# EasyEDA Pro project WiFiController.epro

# Schematic PIR sensor logical invertor
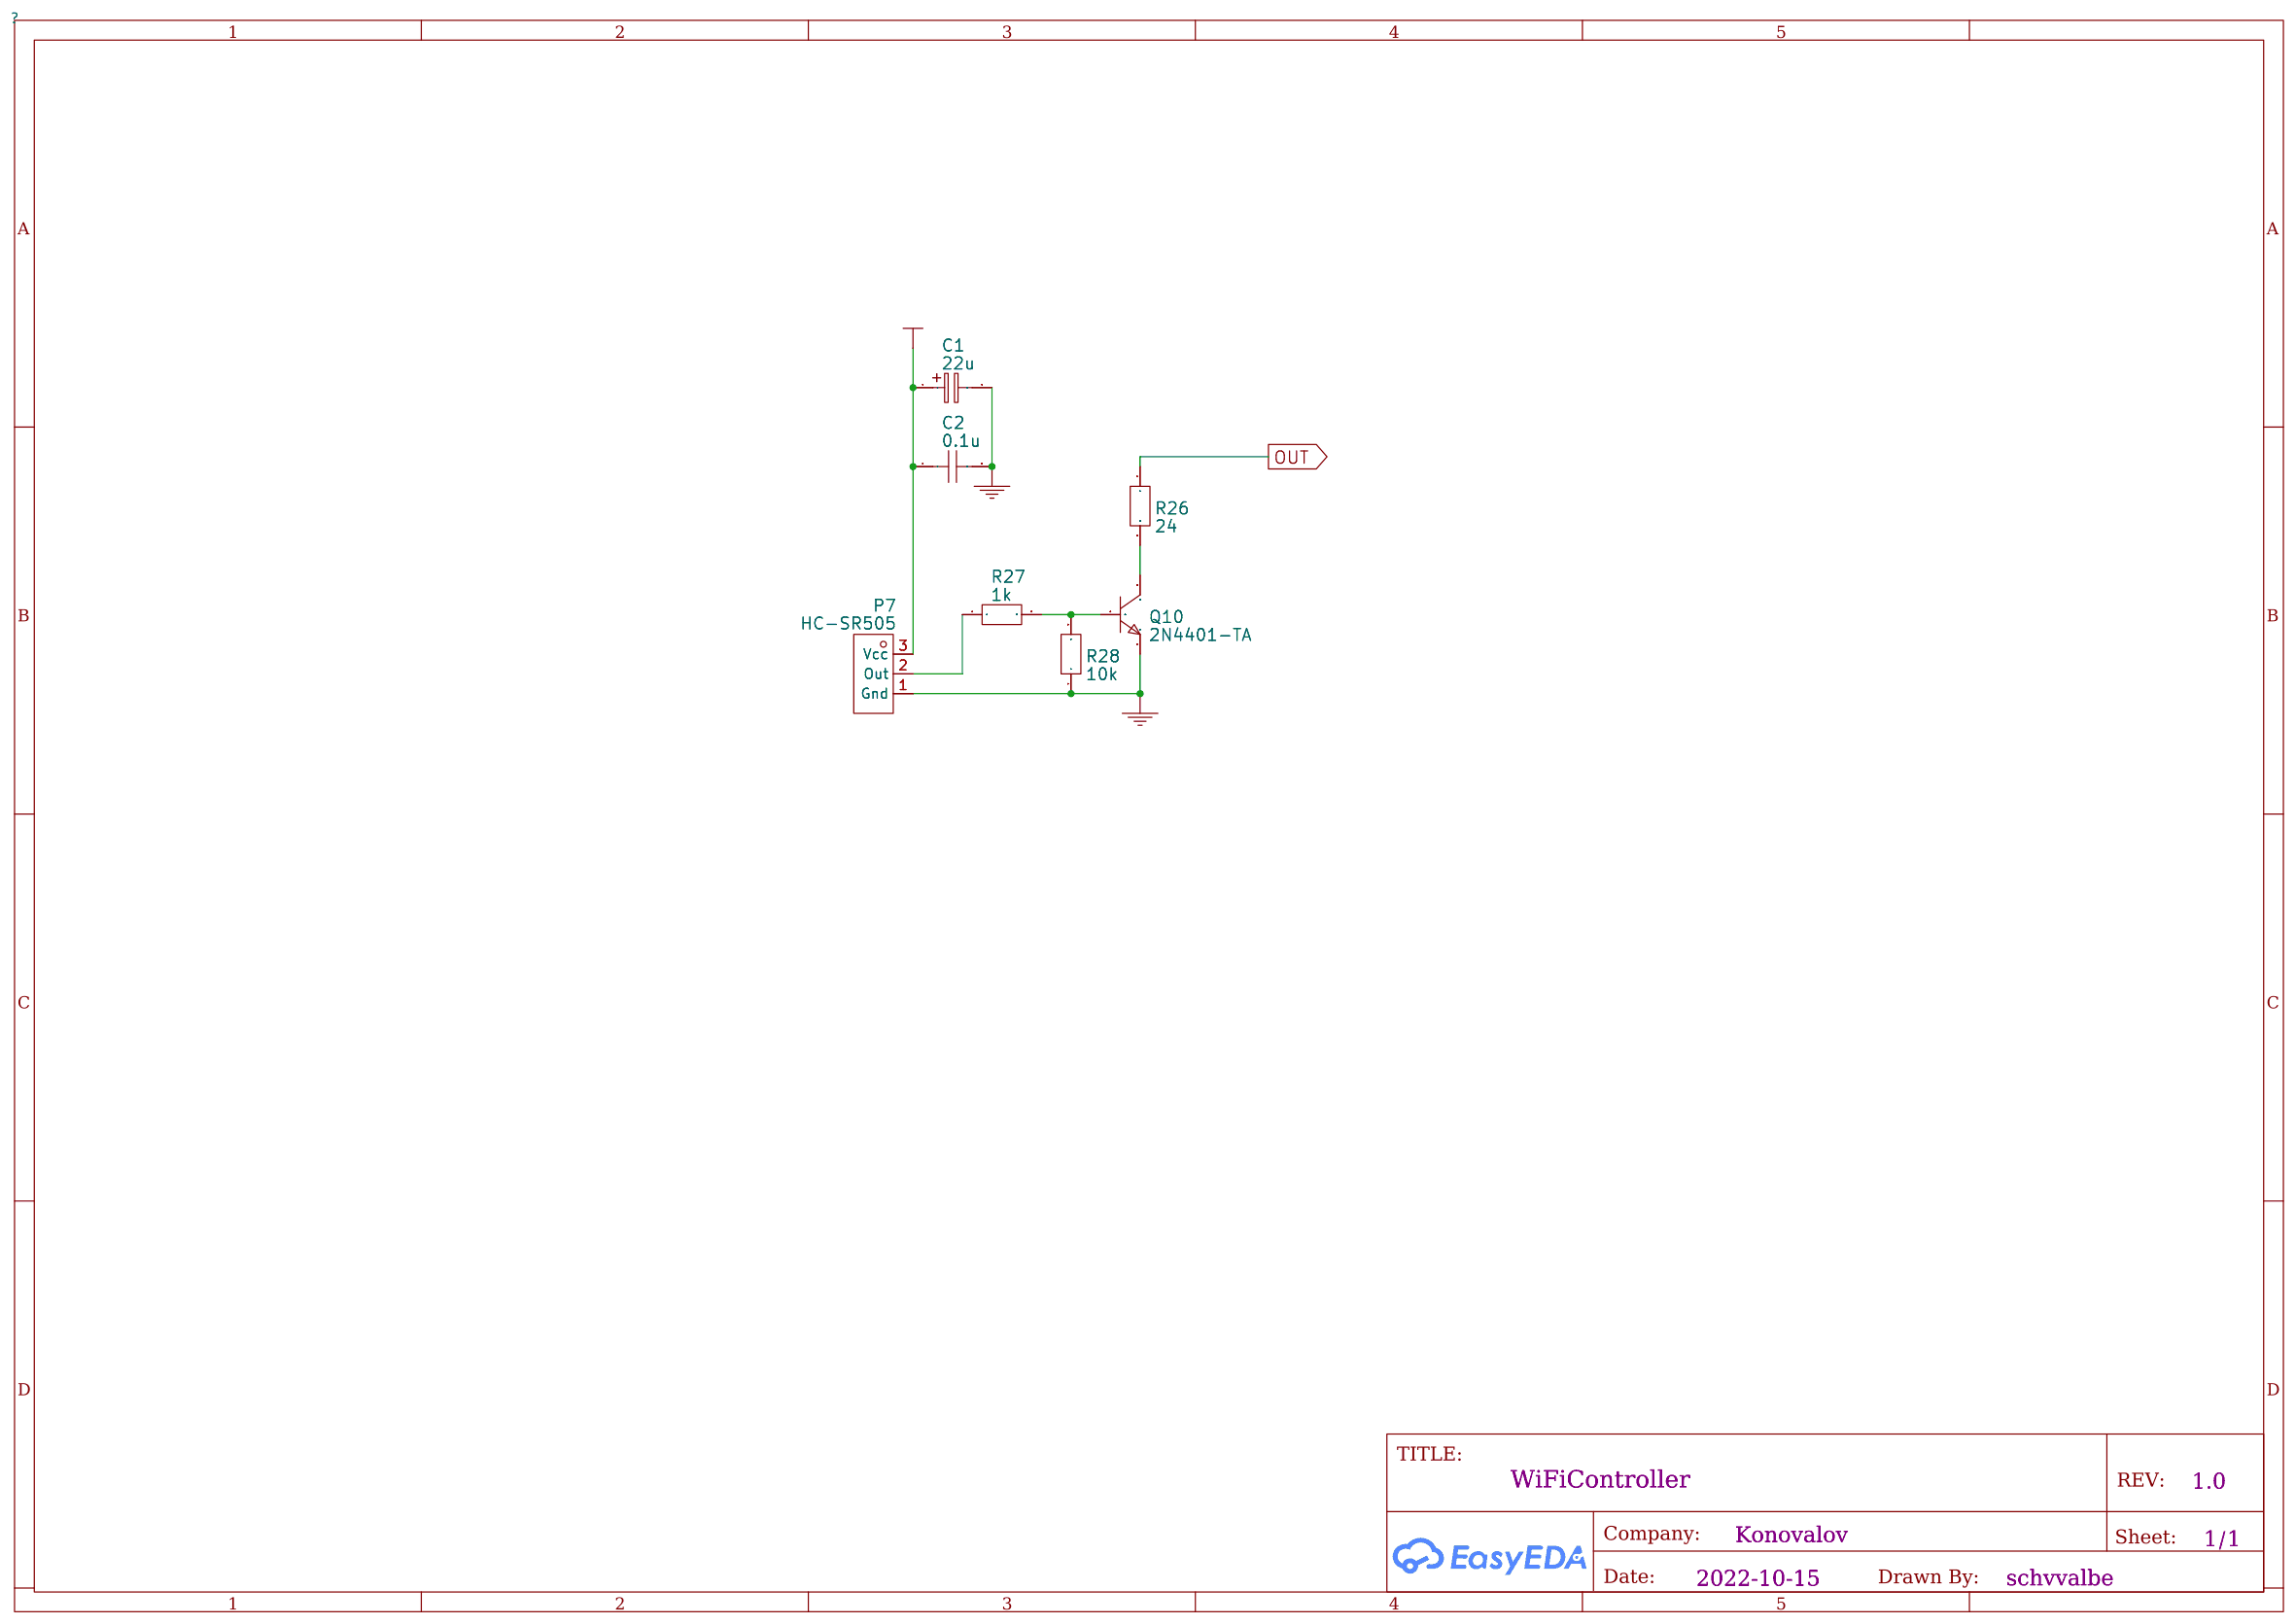
[diagram p0: schematic sheet]

## Parts
C1  22u
C2  0.1u
P7  HC-SR505
Q10  2N4401-TA
R26  24
R27  1k
R28  10k

## Library data of the parts
C1 = 22u
C2 = 0.1u
P7 = DG308-2.54-03P-14-00A(H): Supplier: LCSC; Supplier Part: C691850; Manufacturer: DEGSON; JLCPCB Part Class: Extended Part
Q10 = 2N4401-TA: Supplier: LCSC; Supplier Part: C2910416; Manufacturer: CJ（江苏长电/长晶）
R26 = 24
R27 = 1k
R28 = 10k

## Nets
+12V: C1.1 C2.1 P7.3(Vcc)
GND: C1.2 C2.2 P7.1(Gnd) Q10.1(E) R28.1
OUT: R26.1
Net-(P7-2): P7.2(Out) R27.1
Net-(Q10-2): Q10.2(B) R27.2 R28.2
Net-(Q10-3): Q10.3(C) R26.2

# Schematic ESP8266Board
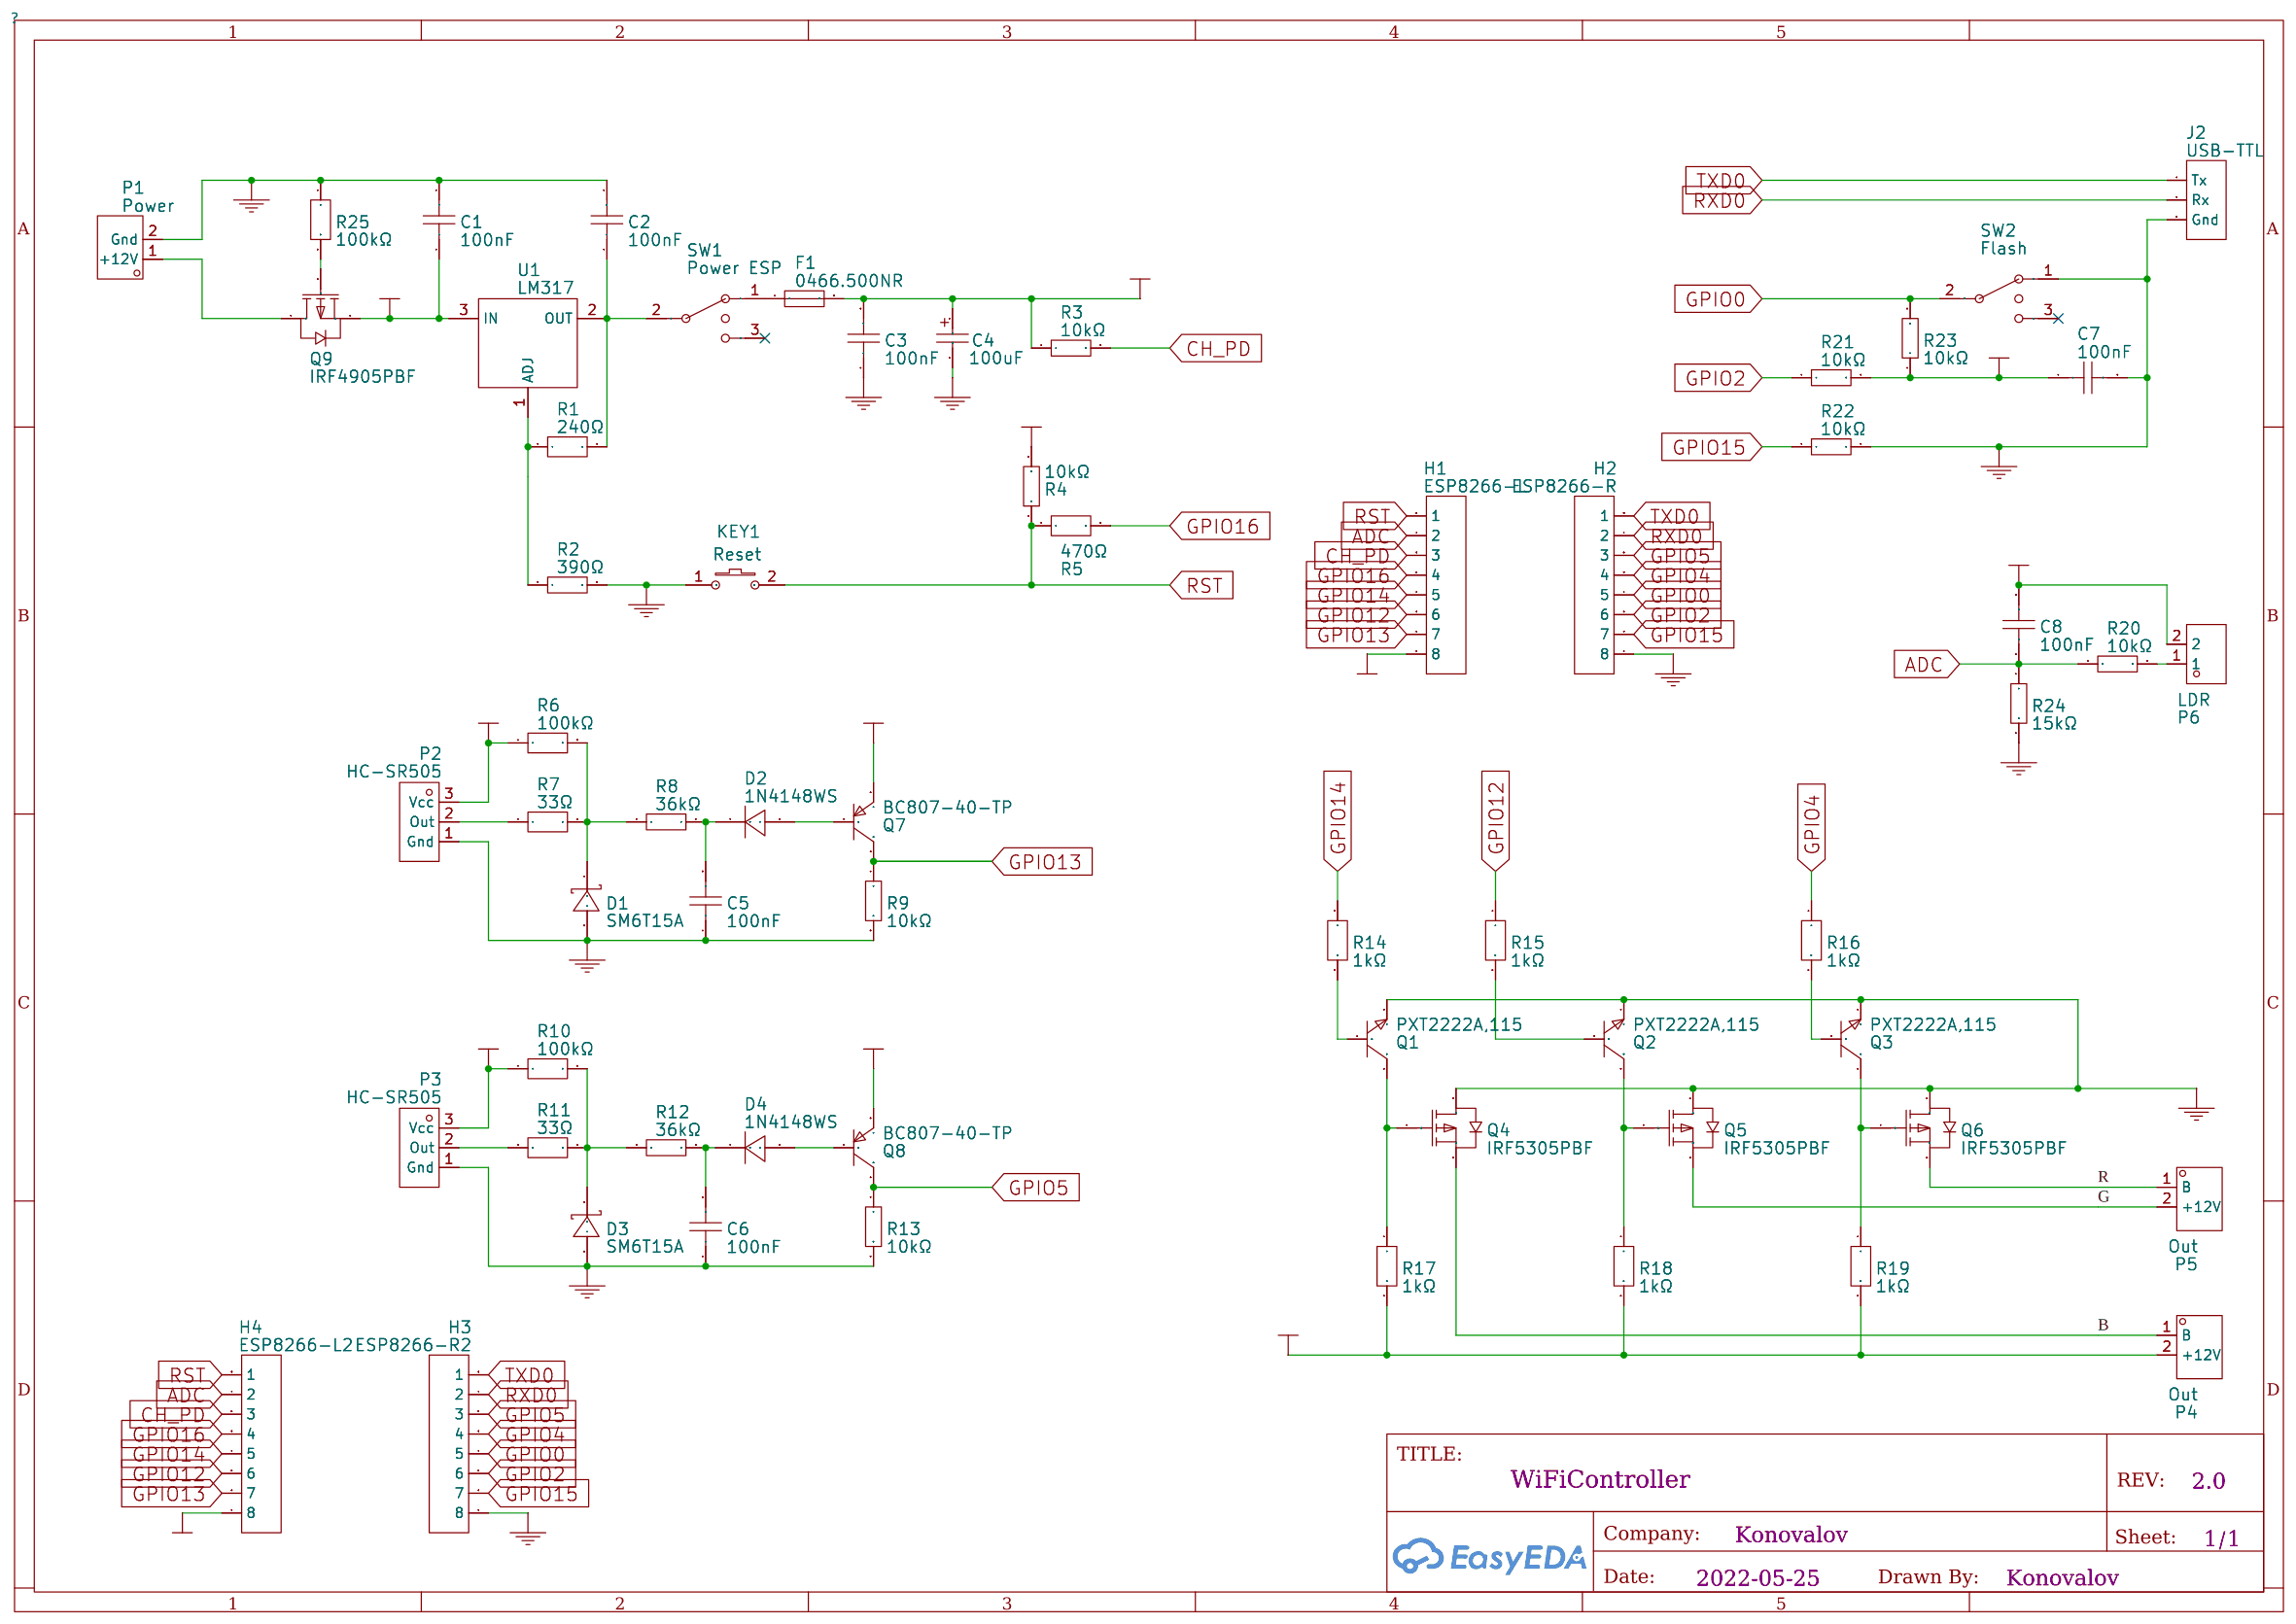
[diagram p1: schematic sheet]

## Parts
C1  100nF  [C1206]
C2  100nF  [C1206]
C3  100nF  [C1206]
C4  100uF  [CAP-SMD_L7.3-W4.3-R-RD]
C5  100nF  [C1206]
C6  100nF  [C1206]
C7  100nF  [C1206]
C8  100nF  [C1206]
D1  SM6T15A  [SMB_L4.6-W3.6-LS5.3-RD]
D2  1N4148WS  [SOD-323F_L2.0-W1.6-LS2.5-RD]
D3  SM6T15A  [SMB_L4.6-W3.6-LS5.3-RD]
D4  1N4148WS  [SOD-323F_L2.0-W1.6-LS2.5-RD]
F1  0466.500NR  [F1206]
H1  ESP8266-L  [HDR-F-2.54_1X8]
H2  ESP8266-R  [HDR-F-2.54_1X8]
H3  ESP8266-R2  [HDR-F-2.54_1X8]
H4  ESP8266-L2  [HDR-F-2.54_1X8]
J2  USB-TTL  [USB-TTL]
KEY1  Reset  [RESET]
P1  Power  [POWER]
P2  HC-SR505  [HC-SR505 2]
P3  HC-SR505  [HC-SR505 2]
P4  Out  [POWER]
P5  Out  [POWER]
P6  LDR  [LDR]
Q1  PXT2222A,115  [SOT-89-3_L4.5-W2.5-P1.50-LS4.1-TR]
Q2  PXT2222A,115  [SOT-89-3_L4.5-W2.5-P1.50-LS4.1-TR]
Q3  PXT2222A,115  [SOT-89-3_L4.5-W2.5-P1.50-LS4.1-TR]
Q4  IRF5305PBF  [TO-220-3_L10.0-W4.5-P2.54-T]
Q5  IRF5305PBF  [TO-220-3_L10.0-W4.5-P2.54-T]
Q6  IRF5305PBF  [TO-220-3_L10.0-W4.5-P2.54-T]
Q7  BC807-40-TP  [SOT-23-3_L2.9-W1.3-P1.90-LS2.4-BR]
Q8  BC807-40-TP  [SOT-23-3_L2.9-W1.3-P1.90-LS2.4-BR]
Q9  IRF4905PBF  [TO-220-3_L10.0-W4.5-P2.54-L]
R1  240Ω  [R0603]
R2  390Ω  [R1206]
R3  10kΩ  [R1206]
R4  10kΩ  [R1206]
R5  470Ω  [R0603]
R6  100kΩ  [R1206]
R7  33Ω  [R1206]
R8  36kΩ  [R1206]
R9  10kΩ  [R1206]
R10  100kΩ  [R1206]
R11  33Ω  [R1206]
R12  36kΩ  [R1206]
R13  10kΩ  [R1206]
R14  1kΩ  [R1206]
R15  1kΩ  [R1206]
R16  1kΩ  [R1206]
R17  1kΩ  [R1206]
R18  1kΩ  [R1206]
R19  1kΩ  [R1206]
R20  10kΩ  [R1206]
R21  10kΩ  [R1206]
R22  10kΩ  [R1206]
R23  10kΩ  [R1206]
R24  15kΩ  [R0805]
R25  100kΩ  [R1206]
SW1  Power ESP  [KLS7-SS03-12D02-EG-3.0]
SW2  Flash  [KLS7-SS03-12D02-EG-3.0]
U1  LM317  [LM317]

## Library data of the parts
C1-C3 C5-C8 = 100nF: link: https://item.szlcsc.com/89171.html; 3DModel: C1206_L3.2-W1.6-H1.3; Supplier: LCSC; Supplier Part: C24497; Manufacturer: CCTC; Manufacturer Part: TCC1206X7R104M500DT; JLCPCB Part Class: Basic
C4 = 100uF: Supplier: LCSC; Manufacturer: AVX; Manufacturer Part: TAJE107M025RNJ; Supplier Part: C7230; JLCPCB Part Class: Extended Part; link: https://item.szlcsc.com/91116.html; 3DModel: CASE-E_L7.3-W4.3-H4.1
D1 D3 = SM6T15A: Supplier: LCSC; Manufacturer: STMicroelectronics; Supplier Part: C118275; JLCPCB Part Class: Extended Part; link: https://item.szlcsc.com/288502.html
D2 D4 = 1N4148WS: Supplier: LCSC; Supplier Part: C2128; Manufacturer: ON Semicon; JLCPCB Part Class: Extended Part; link: https://item.szlcsc.com/111628.html; 3DModel: SOD-323F_L1.6-W1.3-H1.1-LS2.7
F1 = 0466.500NR: Supplier: LCSC; Supplier Part: C206988; Manufacturer: Littelfuse; JLCPCB Part Class: Extended Part; 3DModel: F1206_L3.2-W1.7-H0.6; link: https://atta.szlcsc.com/upload/public/pdf/source/20200518/C553934_4CFF0660EAE88BF7A646763F248900C5.pdf
H1 = ESP8266-L: 3DModel: HDR-F-2.54_1x8; Supplier Part: C225505; Supplier: LCSC
H2 = ESP8266-R: 3DModel: HDR-F-2.54_1x8; Supplier Part: C225505; Supplier: LCSC
H3 = ESP8266-R2: 3DModel: HDR-F-2.54_1x8; Supplier Part: C225505; Supplier: LCSC
H4 = ESP8266-L2: 3DModel: HDR-F-2.54_1x8; Supplier Part: C225505; Supplier: LCSC
J2 = USB-TTL: Supplier Part: C180248; Supplier: LCSC; 3DModel: HDR-M-2.54_1x3
KEY1 = Reset: Supplier Part: C118141; Supplier: LCSC; Manufacturer Part: K2-1107ST-A4SW-06; 制造商: 韩国韩荣; 3DModel: KEY-SMD_2P-L6.2-W3.6-LS8.0; link: https://so.szlcsc.com/global.html?c=&k=C498306
P1 = Power: Supplier Part: C8445; Supplier: LCSC; 3DModel: KF301-2POLES_sp
P2 P3 = HC-SR505: Supplier: LCSC; Supplier Part: C691850; Manufacturer: DEGSON; Manufacturer Part: DG308-2.54-03P-14-00A(H); JLCPCB Part Class: Extended Part; link: https://item.szlcsc.com/723608.html?ref=editor&logined=true; 3DModel: CONN-TH_DG308-2.54-03P-14-00A-H
P4 P5 = Out: Supplier Part: C8445; Supplier: LCSC; 3DModel: KF301-2POLES_sp
P6 = LDR: link: https://item.szlcsc.com/734134.html; 3DModel: CONN-TH_DG308-2.54-02P-14-00A; Supplier: LCSC; Supplier Part: C699496; Manufacturer: DEGSON; Manufacturer Part: DG308-2.54-02P-14-00A(H); JLCPCB Part Class: Extended Part
Q1-Q3 = PXT2222A,115: Supplier: LCSC; Supplier Part: C426879; Manufacturer: Nexperia; JLCPCB Part Class: Extended Part; link: https://item.szlcsc.com/141709.html; 3DModel: SOT-89-3_L4.3-W2.5-H1.6-LS4.1-P1.50
Q4-Q6 = IRF5305PBF: Supplier: LCSC; Manufacturer: IR; Supplier Part: C2623; JLCPCB Part Class: Extended Part; link: https://item.szlcsc.com/88574.html; 3DModel: TO-220-3_L10.0-W4.5-P2.54
Q7 Q8 = BC807-40-TP: link: https://www.diodes.com/assets/Package-Files/SOT23.pdf; 3DModel: SOT-23-3P_L2.9-W1.3-H1.0-LS2.4-P0.95; Supplier: LCSC; Supplier Part: C668872; Manufacturer: MCC(Micro Commercial Components); JLCPCB Part Class: Extended Part
Q9 = IRF4905PBF: link: https://item.szlcsc.com/233115.html; Supplier: LCSC; Supplier Part: C558142; Manufacturer: VBsemi Elec; JLCPCB Part Class: Extended Part
R1 = 240Ω: Supplier: LCSC; Supplier Part: C23350; Manufacturer: PANASONIC; Manufacturer Part: ERA3AEB241V; JLCPCB Part Class: Extended Part; 3DModel: R0603_L1.6-W0.8-H0.8; link: https://www.mouser.in/datasheet/2/447/PYu_RT_1_to_0_01_RoHS_L_11-1669912.pdf
R2 = 390Ω: Supplier: LCSC; Manufacturer: FH; Manufacturer Part: RS-06K3900FT; Supplier Part: C140022; Resistance: 390; JLCPCB Part Class: Extended Part; link: https://item.szlcsc.com/311874.html; 3DModel: R1206_L3.2-W1.6-H0.6
R3 R9 R13 R20-R23 = 10kΩ: link: https://item.szlcsc.com/311874.html; 3DModel: R1206_L3.2-W1.6-H0.6; Supplier: LCSC; Supplier Part: C17902; Manufacturer: Viking Tech; Manufacturer Part: AR06BTCV1002; Resistance: 10K; JLCPCB Part Class: Extended Part
R4 = 10kΩ: Supplier: LCSC; Supplier Part: C17902; Manufacturer: Viking Tech; Manufacturer Part: AR06BTCV1002; Resistance: 10K; JLCPCB Part Class: Extended Part; link: https://item.szlcsc.com/311874.html; 3DModel: R1206_L3.2-W1.6-H0.6
R5 = 470Ω: Supplier: LCSC; Supplier Part: C23179; Manufacturer: Viking Tech; Manufacturer Part: AR03BTC4700; JLCPCB Part Class: Extended Part; 3DModel: R0603_L1.6-W0.8-H0.8; link: https://www.mouser.in/datasheet/2/447/PYu_RT_1_to_0_01_RoHS_L_11-1669912.pdf
R6 R10 R25 = 100kΩ: link: https://item.szlcsc.com/311874.html; 3DModel: R1206_L3.2-W1.6-H0.6; Supplier: LCSC; Supplier Part: C17900; Manufacturer: Viking Tech; Manufacturer Part: ARG06BTC1003; Resistance: 100K; JLCPCB Part Class: Extended Part
R7 R11 = 33Ω: Supplier: LCSC; Supplier Part: C966057; Manufacturer: UNI-ROYAL(Uniroyal Elec); Manufacturer Part: AS06W2J0330T5E; JLCPCB Part Class: Extended Part; link: https://item.szlcsc.com/311874.html; 3DModel: R1206_L3.2-W1.6-H0.6
R8 R12 = 36kΩ: Supplier: LCSC; Manufacturer: YAGEO; Manufacturer Part: RT1206BRD0736KL; Supplier Part: C136884; JLCPCB Part Class: Extended Part; link: https://item.szlcsc.com/311874.html; 3DModel: R1206_L3.2-W1.6-H0.6
R14-R19 = 1kΩ: Supplier: LCSC; Supplier Part: C4410; Manufacturer: YAGEO; Manufacturer Part: RT1206DRD071KL; JLCPCB Part Class: Extended Part; link: https://item.szlcsc.com/311874.html; 3DModel: R1206_L3.2-W1.6-H0.6
R24 = 15kΩ: link: https://item.szlcsc.com/142685.html; 3DModel: R0805_L2.0-W1.3-H0.6; Supplier: LCSC; Manufacturer: UniOhm; Manufacturer Part: 0805W8F1502T5E; Supplier Part: C17475; Resistance: 15K; JLCPCB Part Class: Basic Part
SW1 = Power ESP: Supplier: LCSC; Supplier Part: C273378; Manufacturer: E-Switch; Manufacturer Part: 500SSP1S1M2REA; 3DModel: SW-TH_SS-12D01-GX
SW2 = Flash: Supplier: LCSC; Supplier Part: C273378; Manufacturer: E-Switch; Manufacturer Part: 500SSP1S1M2REA; 3DModel: SW-TH_SS-12D01-GX
U1 = LM317: Supplier: LCSC; Manufacturer: CJ; Supplier Part: C22147; JLCPCB Part Class: Extended Part; link: https://item.szlcsc.com/233115.html; 3DModel: TO-220-3_L10.0-W4.5-P2.54-L

## Nets
+3.3V: C3.2 C4.1 C7.1 C8.2 F1.2 H1.1(8) H4.1(8) P6.2 Q7.2(E) Q8.2(E) R3.1 R4.2 R21.2 R23.1
+12V: C1.1 P2.3(Vcc) P3.3(Vcc) P4.2(+12V) Q9.3(S) R6.1 R10.1 R17.2 R18.2 R19.2 U1.3(IN)
GND: C1.2 C2.2 C3.1 C4.2 C5.1 C6.1 C7.2 D1.2(A) D3.2(A) H2.1(8) H3.1(8) J2.3(Gnd) KEY1.1 P1.2(Gnd) P2.1(Gnd) P3.1(Gnd) Q1.1(E) Q2.1(E) Q3.1(E) Q4.2(D) Q5.2(D) Q6.2(D) R2.2 R9.2 R13.2 R22.2 R24.2 R25.1 SW2.1
ADC: C8.1 H1.7(2) H4.7(2) R20.1 R24.1
B: P4.1(B) Q4.3(S)
CH_PD: H1.6(3) H4.6(3) R3.2
G: P5.2(G) Q5.3(S)
GPIO0: H2.4(5) H3.4(5) R23.2 SW2.2
GPIO2: H2.3(6) H3.3(6) R21.1
GPIO4: H2.5(4) H3.5(4) R16.1
GPIO5: H2.6(3) H3.6(3) Q8.3(C) R13.1
GPIO12: H1.3(6) H4.3(6) R15.1
GPIO13: H1.2(7) H4.2(7) Q7.3(C) R9.1
GPIO14: H1.4(5) H4.4(5) R14.1
GPIO15: H2.2(7) H3.2(7) R22.1
GPIO16: H1.5(4) H4.5(4) R5.2
R: P5.1(R) Q6.3(S)
RST: H1.8(1) H4.8(1) KEY1.2 R4.1 R5.1
RXD0: H2.7(2) H3.7(2) J2.2(Rx)
TXD0: H2.8(1) H3.8(1) J2.1(Tx)
C5_2: C5.2 D2.1(C) R8.2
D1_1: D1.1(K) R6.2 R7.2 R8.1
D2_2: D2.2(A) Q7.1(B)
Net-(Q1-2): Q1.2(C) Q4.1(G) R17.1
Net-(Q2-2): Q2.2(C) Q5.1(G) R18.1
Net-(Q3-2): Q3.2(C) Q6.1(G) R19.1
P1_1: P1.1(+12V) Q9.2(D)
P2_2: P2.2(Out) R7.1
P6_1: P6.1 R20.2
Q8_1: D4.2(A) Q8.1(B)
R10_2: D3.1(K) R10.2 R11.2 R12.1
R11_1: P3.2(Out) R11.1
R12_2: C6.2 D4.1(C) R12.2
R14_2: Q1.3(B) R14.2
R15_2: Q2.3(B) R15.2
R16_2: Q3.3(B) R16.2
R25_2: Q9.1(G) R25.2
SW1_1: F1.1 SW1.1
SW1_2: C2.1 R1.2 SW1.2 U1.2(OUT)
U1_1: R1.1 R2.1 U1.1(ADJ)

Not connected (* = marked no-connect by the designer): SW1 3*; SW2 3*

# Board 1-PCB_ESP8266Board
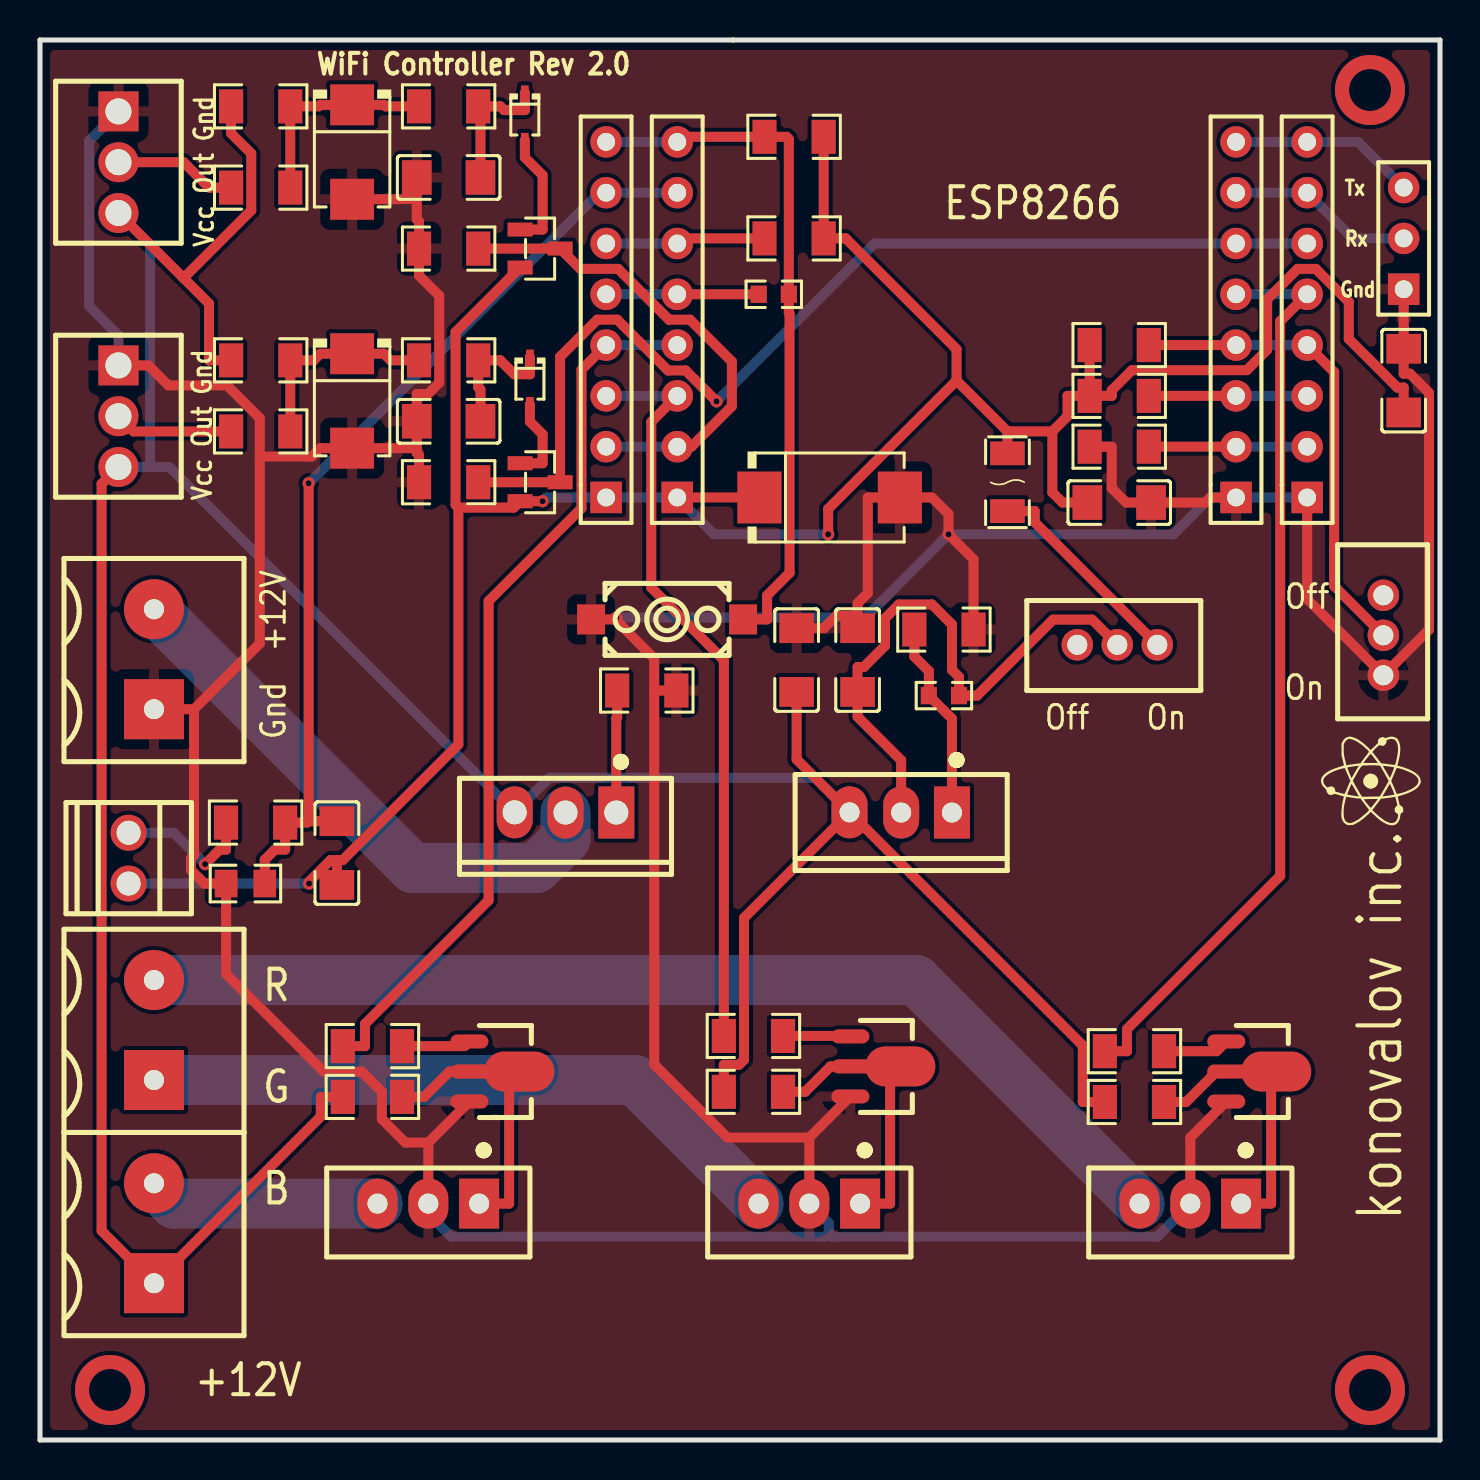
[diagram p2: board, top side]
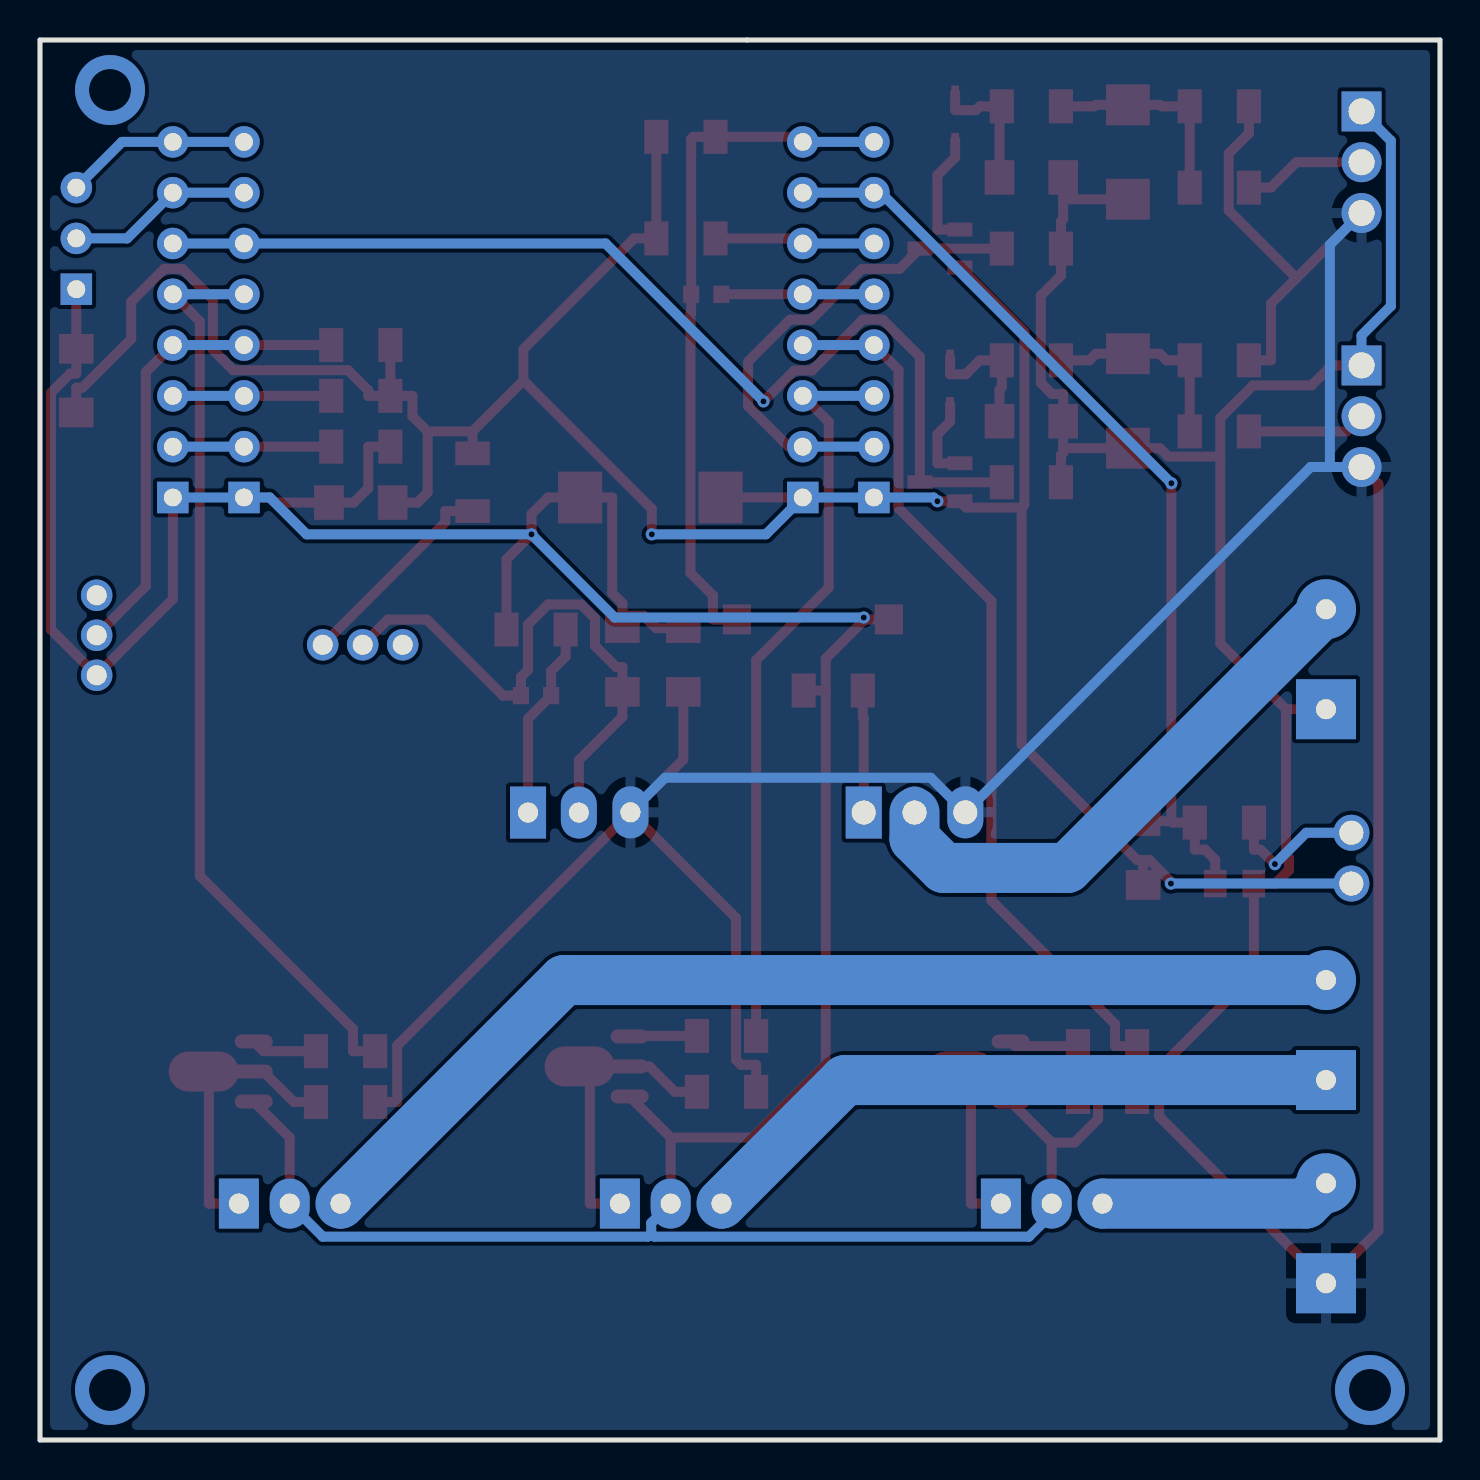
[diagram p3: board, bottom side, seen from below]

Outline 70 x 70 mm; copper layers: Top Layer, Bottom Layer. Coordinates in mm from the lower left corner of the outline.
Outline path: 0,70 70,70 70,0 0,0 0,70
Stack: Top Layer 0.035mm / Dielectric1 1.51mm FR4 er 4.5 / Bottom Layer 0.035mm

## Design rules (mm)
spacing Default (default): track to track 0.152, other pairs 0 to 0.152
spacing ESP_power: track to track 0.152, other pairs 0 to 0.152
spacing Power: track to track 0.152, other pairs 0 to 0.152
track width Default (default): min 0.5, default 0.5, max 25.4
track width ESP_power: min 0.5, default 0.5, max 25.4
track width Power: min 2.5, default 2.5, max 25.4
differential pair differentialPair (default): width min 0.127, default 0.254, max 2.54; gap min 0.152, default 0.152
via Default (default): diameter min 0.61, default 0.61, max 100.025; hole min 0.305, default 0.305, max 59.995
via ESP_power: diameter min 0.61, default 0.61, max 100.025; hole min 0.305, default 0.305, max 59.995
via Power: diameter min 0.61, default 0.61, max 100.025; hole min 0.305, default 0.305, max 59.995
net G uses Power
net B uses Power
net R uses Power
net P1_1 uses Power
net GND uses gge2551
pour e387 uses gge2551

## Placement (name value [footprint] x y rotation side)
C1  100nF  [C1206]  37.83 39 90 top
C2  100nF  [C1206]  40.88 39 90 top
C3  100nF  [C1206]  53.96 46.87 180 top
C4  100uF  [CAP-SMD_L7.3-W4.3-R-RD]  39.48 47.13 180 top
C5  100nF  [C1206]  20.43 63.13 0 top
C6  100nF  [C1206]  20.43 50.94 0 top
C7  100nF  [C1206]  68.18 52.97 90 top
C8  100nF  [C1206]  14.84 29.35 270 top
D1  SM6T15A  [SMB_L4.6-W3.6-LS5.3-RD]  15.61 64.4 270 top
D2  1N4148WS  [SOD-323F_L2.0-W1.6-LS2.5-RD]  24.24 66.18 270 top
D3  SM6T15A  [SMB_L4.6-W3.6-LS5.3-RD]  15.61 51.95 270 top
D4  1N4148WS  [SOD-323F_L2.0-W1.6-LS2.5-RD]  24.5 52.97 270 top
F1  0466.500NR  [F1206]  48.37 47.89 90 top
H1  ESP8266-L  [HDR-F-2.54_1X8]  31.86 54.75 90 top
H2  ESP8266-R  [HDR-F-2.54_1X8]  59.8 54.75 90 top
H3  ESP8266-R2  [HDR-F-2.54_1X8]  63.36 54.75 90 top
H4  ESP8266-L2  [HDR-F-2.54_1X8]  28.31 54.75 90 top
J2  -  [USB-TTL]  68.18 60.08 270 top
KEY1  Reset  [RESET]  31.35 41.03 0 top
P1  Power  [POWER]  5.7 39 270 top
P2  HC-SR505  [HC-SR505 2]  3.92 63.89 270 top
P3  HC-SR505  [HC-SR505 2]  3.92 51.19 270 top
P4  Out  [POWER]  5.7 10.3 270 top
P5  Out  [POWER]  5.7 20.46 270 top
P6  -  [LDR]  4.43 29.09 270 top
Q1  PXT2222A,115  [SOT-89-3_L4.5-W2.5-P1.50-LS4.1-TR]  22.72 18.43 180 top
Q2  PXT2222A,115  [SOT-89-3_L4.5-W2.5-P1.50-LS4.1-TR]  41.77 18.68 180 top
Q3  PXT2222A,115  [SOT-89-3_L4.5-W2.5-P1.50-LS4.1-TR]  60.56 18.43 180 top
Q4  IRF5305PBF  [TO-220-3_L10.0-W4.5-P2.54-T]  19.42 11.82 270 top
Q5  IRF5305PBF  [TO-220-3_L10.0-W4.5-P2.54-T]  38.47 11.82 270 top
Q6  IRF5305PBF  [TO-220-3_L10.0-W4.5-P2.54-T]  57.52 11.82 270 top
Q7  BC807-40-TP  [SOT-23-3_L2.9-W1.3-P1.90-LS2.4-BR]  25 59.57 180 top
Q8  BC807-40-TP  [SOT-23-3_L2.9-W1.3-P1.90-LS2.4-BR]  25 47.89 180 top
Q9  IRF4905PBF  [TO-220-3_L10.0-W4.5-P2.54-L]  26.27 31.38 180 top
R1  240Ω  [R0603]  45.2 37.22 0 top
R2  390Ω  [R1206]  45.2 40.52 0 top
R3  10kΩ  [R1206]  37.7 60.08 180 top
R4  10kΩ  [R1206]  37.7 65.16 0 top
R5  470Ω  [R0603]  36.69 57.29 180 top
R6  100kΩ  [R1206]  11.03 66.69 0 top
R7  33Ω  [R1206]  11.03 62.62 0 top
R8  36kΩ  [R1206]  20.43 66.69 0 top
R9  10kΩ  [R1206]  20.43 59.57 180 top
R10  100kΩ  [R1206]  11.03 53.98 0 top
R11  33Ω  [R1206]  11.03 50.43 0 top
R12  36kΩ  [R1206]  20.43 53.98 0 top
R13  10kΩ  [R1206]  20.43 47.89 180 top
R14  1kΩ  [R1206]  16.62 19.7 0 top
R15  1kΩ  [R1206]  35.67 20.2 0 top
R16  1kΩ  [R1206]  54.72 19.44 0 top
R17  1kΩ  [R1206]  16.62 17.16 180 top
R18  1kΩ  [R1206]  35.67 17.41 180 top
R19  1kΩ  [R1206]  54.72 16.9 180 top
R20  10kΩ  [R1206]  10.78 30.87 180 top
R21  10kΩ  [R1206]  53.96 52.21 180 top
R22  10kΩ  [R1206]  53.96 49.67 180 top
R23  10kΩ  [R1206]  53.96 54.75 0 top
R24  15kΩ  [R0805]  10.27 27.82 180 top
R25  100kΩ  [R1206]  30.34 37.48 180 top
SW1  Power ESP  [KLS7-SS03-12D02-EG-3.0]  55.87 39.76 180 top
SW2  Flash  [KLS7-SS03-12D02-EG-3.0]  67.17 38.24 90 top
U1  -  [LM317]  43.04 31.38 180 top

## Footprints (pads in the part's own frame, mm; a bottom-side part is the same pattern mirrored in y, then rotated)
C1206
  rect 1.485x1.728 smd: 1(-1.593,0) 2(1.593,0)
CAP-SMD_L7.3-W4.3-R-RD
  rect 2.208x2.592 smd: 1(3.511,0) 2(-3.511,0)
F1206
  rect 1.19x1.728 smd: 1(-1.445,0) 2(1.445,0)
HC-SR505 2
  rect 2x2 hole 1.3: 1(-2.54,0)
  round 2 hole 1.3: 2(0,0) 3(2.54,0)
HDR-F-2.54_1X8
  rect 1.575x1.575 hole 0.889: 1(-7.62,0)
  round 1.575 hole 0.889: 2(-5.08,0) 3(-2.54,0) 4(0,0) 5(2.54,0) 6(5.08,0) 7(7.62,0) 8(10.16,0)
KLS7-SS03-12D02-EG-3.0
  round 1.575 hole 1: 1(0,0) 2(2,0) 3(4,0)
LDR
  round 1.8 hole 1.2: 1(-1.27,0) 2(1.27,0)
LM317
  rect 1.8x2.6 hole 1: 1(-2.56,0.005)
  oval 1.8x2.6 hole 1: 2(-0.02,0.005) 3(2.56,-0.005)
POWER
  round 3 hole 1: 1(-2.54,0)
  rect 3x3 hole 1: 2(2.458,0)
R0603
  rect 0.806x0.864 smd: 1(-0.753,0) 2(0.753,0)
R0805
  rect 1.133x1.377 smd: 1(-0.966,0) 2(0.966,0)
R1206
  rect 1.208x1.701 smd: 1(-1.479,0) 2(1.479,0)
RESET
  rect 1.4x1.5 smd: 1(-3.8,0) 2(3.8,0)
SMB_L4.6-W3.6-LS5.3-RD
  rect 2.047x2.192 smd: 1(-2.361,0) 2(2.361,0)
SOD-323F_L2.0-W1.6-LS2.5-RD
  rect 0.73x0.385 smd: 1(-1.185,0) 2(1.185,0)
SOT-23-3_L2.9-W1.3-P1.90-LS2.4-BR
  rect 1.25x0.7 smd: 1(1,-0.95) 2(1,0.95) 3(-1,0)
SOT-89-3_L4.5-W2.5-P1.50-LS4.1-TR
  oval 1.9x0.7 smd: 1(1.25,1.501) 3(1.25,-1.501)
  oval 3.5x2 smd: 2(-1.25,0)
  oval 2.1x0.7 smd: 4(1.151,0)
TO-220-3_L10.0-W4.5-P2.54-L
  rect 1.8x2.6 hole 1.2: 1(-2.541,0.005)
  oval 1.8x2.6 hole 1.2: 2(-0.001,0.005) 3(2.54,-0.005)
TO-220-3_L10.0-W4.5-P2.54-T
  rect 2.5x2 hole 1: 1(0,2.54)
  oval 2.5x2 hole 1: 2(0,0) 3(0,-2.54)
USB-TTL
  round 1.575 hole 0.889: 1(-2.54,0) 2(0,0)
  rect 1.575x1.575 hole 0.889: 3(2.54,0)

## Nets
As in the schematic, except:
Q4_1: Q1.2 Q1.4 Q4.1 R17.1
Q5_1: Q2.2 Q2.4 Q5.1 R18.1
Q6_1: Q3.2 Q3.4 Q6.1 R19.1

Pads without a net: SW1 3; SW2 3

## Via types
v1: diameter 3.5, hole 2.1, Top Layer to Bottom Layer, 3 vias
v2: diameter 0.61, hole 0.305, Top Layer to Bottom Layer, 8 vias

## Routing (per net, layer and track width the routed paths; a pad name or vN(x,y) marks a point on that pad's centre or on a via; arc(x,y) is an arc through that point)
+3.3V: length 137.9
  Top Layer w0.5: 14.84,29 15.14,29 20.92,34.78 20.92,46.62 ; 14.84,29 14.53,29 13.46,27.92 v2(13.46,27.82) ; 14.84,29 C8.2 ; v2(39.41,45.29) 39.41,46.56 45.83,52.98 ; R21.2 51.38,52.21 51.38,51.19 50.62,50.43 ; R21.2 53.59,52.21 53.59,52.48 54.6,53.49 60.34,53.49 61.36,54.51 61.36,57.03 62.88,58.56 63.79,58.56 65.44,56.91 65.44,55.05 67.87,52.62 68.18,52.62 C7.1 ; R21.2 R23.1 ; 45.83,52.98 45.83,54.54 40.29,60.08 R3.1 R4.2 ; 45.83,52.98 48.37,50.43 ; 50.62,50.43 48.37,50.43 ; 50.62,50.43 50.62,47.38 51.12,46.87 C3.2 ; 48.37,50.43 F1.2 ; 20.92,46.62 20.78,46.76 20.78,55.4 Q7.2 ; 20.92,46.62 23.69,46.62 Q8.2 v2(25.13,46.94) ; C4.1 H1.1
  Bottom Layer w0.5: P6.2 v2(13.46,27.82) ; v2(39.41,45.29) 33.7,45.29 H1.1 H4.1 25.32,47.13 v2(25.13,46.94)
+12V: length 179.9
  Top Layer w0.5: R17.2 14.04,17.16 14.04,16.18 P4.2 3.08,10.46 3.08,47.81 P3.3 ; U1.3 52.14,19.72 52.14,16.9 R19.2 ; U1.3 37.83,34.03 C1.1 ; U1.3 35.2,26.11 35.2,19.01 34.95,18.76 34.19,18.76 R18.2 ; 7.18,58.1 8.45,56.82 8.45,53.98 9.56,53.98 ; 7.18,58.1 P2.3 ; 7.18,58.1 10.56,61.48 10.56,64.33 9.56,65.33 9.56,66.69
  Bottom Layer w0.5: U1.3 38.75,33.12 25.47,33.12 Q9.3 6.47,48.65 5.51,48.65 ; P2.3 5.51,59.77 5.51,48.65 ; 5.51,48.65 P3.3
GND: length 290.4
  Top Layer w0.5: H2.1 58.51,47.13 58.26,46.87 C3.1 54.31,46.87 53.59,47.6 53.59,49.67 R22.2 ; C1.2 39.2,40.59 39.82,41.21 40.88,41.21 ; J2.3 C7.2 68.18,53.32 68.49,53.32 69.45,52.36 69.45,40.52 SW2.1 63.36,42.05 H3.1 ; 30.71,37.48 30.71,39.07 28.75,41.03 ; 30.71,37.48 R25.1 ; 30.71,37.48 30.71,18.78 34.36,15.13 38.47,15.13 ; 18.84,49.59 D3.2 14.01,49.59 13.59,49.18 10.99,49.18 ; 18.84,49.59 18.84,49.35 18.95,49.24 R13.2 ; 18.84,49.59 C6.1 18.84,52.3 19.4,52.3 19.96,52.86 19.96,57.21 18.95,58.22 R9.2 18.95,60.92 18.84,61.04 18.84,62.04 ; v2(28.81,41.12) 28.81,41.09 28.75,41.03 ; 28.75,41.03 KEY1.1 ; 7.7,36.54 10.99,39.83 10.99,49.18 ; 7.7,36.54 7.7,29.24 7.55,29.09 7.55,28.5 8.23,27.82 R24.2 9.31,23.31 14.21,18.41 16.11,18.41 17.09,17.42 17.09,16.05 18.27,14.87 19.42,14.87 ; 7.7,36.54 P1.2 ; Q6.2 57.52,15.13 Q3.1 ; 40.88,41.21 40.88,41.83 41.39,42.34 41.39,47.13 C4.2 44.6,47.13 45.43,46.3 v2(45.43,45.29) 46.68,44.04 R2.2 ; 40.88,41.21 C2.2 ; 38.47,15.13 Q2.1 ; 38.47,15.13 Q5.2 ; 10.99,49.18 10.99,51.1 9.35,52.73 6.42,52.73 5.42,53.73 P3.1 ; D1.2 18.84,62.04 ; 18.84,62.04 C5.1 ; 19.42,14.87 Q1.1 ; 19.42,14.87 Q4.2
  Bottom Layer w0.5: 39.44,10.33 39.44,10.85 Q5.2 ; 39.44,10.33 39.28,10.17 20.55,10.17 19.42,11.3 Q4.2 ; 39.44,10.33 39.6,10.17 55.86,10.17 Q6.2 ; H3.1 H2.1 58.51,47.13 56.67,45.29 v2(45.43,45.29) 41.26,41.12 v2(28.81,41.12) ; P3.1 3.92,55.23 2.46,56.7 2.46,64.97 P2.1
(no net):
  vias: v1(3.5,2.5) v1(66.5,67.5) v1(66.5,2.5)
ADC: length 47.7
  Top Layer w0.5: 13.43,30.94 v2(13.43,47.84) ; 13.43,30.94 C8.1 ; 13.43,30.94 13.36,30.87 12.26,30.87 12.26,29.52 11.75,29.52 11.24,29.01 R24.1
  Bottom Layer w0.5: H1.7 H4.7 27.96,62.37 v2(13.43,47.84)
B: length 11.6
  Bottom Layer w2.5: P4.1 6.72,11.82 Q4.3
C5_2: length 7
  Top Layer w0.5: R8.2 22.46,66.69 ; 22.46,66.69 22.02,66.25 C5.2 ; 22.46,66.69 23.01,66.69 23.2,66.5 24.24,66.5 D2.1
CH_PD: length 8
  Top Layer w0.5: H1.6 32.12,60.08 R3.2
  Bottom Layer w0.5: H1.6 H4.6
D1_1: length 10.6
  Top Layer w0.5: R7.2 R6.2 13.93,66.69 14.01,66.76 D1.1 17.2,66.76 17.28,66.69 R8.1
D2_2: length 6
  Top Layer w0.5: D2.2 24.24,64.13 25.13,63.24 25.13,60.52 Q7.1
G: length 32.8
  Bottom Layer w2.5: Q5.3 29.75,18 P5.2
GPIO0: length 24
  Top Layer w0.5: H3.4 64.71,53.4 64.71,42.7 SW2.2 ; R23.2 H2.4
  Bottom Layer w0.5: H2.4 H3.4
GPIO2: length 7.9
  Top Layer w0.5: R21.1 H2.3
  Bottom Layer w0.5: H2.3 H3.3
GPIO4: length 46.2
  Top Layer w0.5: H3.5 62.01,55.94 62.01,28.21 54.35,20.55 54.35,19.44 R16.1
  Bottom Layer w0.5: H2.5 H3.5
GPIO5: length 53.4
  Top Layer w0.5: v2(33.83,51.93) 32.28,53.48 31.4,53.48 28.86,56.02 27.86,56.02 26,54.16 Q8.3 R13.1
  Bottom Layer w0.5: H3.6 H2.6 41.72,59.83 v2(33.83,51.93)
GPIO12: length 37.6
  Top Layer w0.5: H1.3 30.56,50.91 30.56,42.62 34.19,38.99 R15.1
  Bottom Layer w0.5: H1.3 H4.3
GPIO13: length 24.4
  Top Layer w0.5: H1.2 32.57,49.67 34.59,51.69 34.59,53.92 32.5,56.02 31.45,56.02 28.91,58.56 27.02,58.56 Q7.3 R9.1
  Bottom Layer w0.5: H1.2 H4.2
GPIO14: length 44.7
  Top Layer w0.5: R14.1 16.25,19.7 16.25,20.8 22.43,26.98 22.43,41.95 27.07,46.59 27.07,53.52 H4.4
  Bottom Layer w0.5: H1.4 H4.4
GPIO15: length 7.9
  Top Layer w0.5: R22.1 H2.2
  Bottom Layer w0.5: H2.2 H3.2
GPIO16: length 7.6
  Top Layer w0.5: R5.2 H1.5
  Bottom Layer w0.5: H1.5 H4.5
P1_1: length 27.8
  Bottom Layer w2.5: P1.1 18.64,28.6 24.81,28.6 26.27,30.07 Q9.2
P2_2: length 6.2
  Top Layer w0.5: 9.56,62.62 8.45,62.62 7.18,63.89 P2.2
P6_1: length 7.2
  Top Layer w0.5: v2(8.26,28.8) 8.98,29.52 9.3,29.52 R20.2
  Bottom Layer w0.5: P6.1 6.69,30.36 v2(8.26,28.8)
Q4_1: length 14.4
  Top Layer w0.5: Q4.1 23.46,11.82 23.46,17.91 ; 18.1,17.16 19.21,17.16 20.47,18.43 Q1.4 22.95,18.43 23.46,17.91 ; 23.46,17.91 Q1.2
Q5_1: length 14.7
  Top Layer w0.5: 42.51,18.17 42.51,11.82 Q5.1 ; 42.51,18.17 42,18.68 Q2.4 39.53,18.68 38.25,17.41 R18.1 ; 42.51,18.17 Q2.2
Q6_1: length 14.3
  Top Layer w0.5: 61.56,18.17 61.3,18.43 Q3.4 58.83,18.43 57.31,16.9 56.2,16.9 ; 61.56,18.17 Q3.2 ; 61.56,18.17 61.56,11.82 Q6.1
Q8_1: length 4.3
  Top Layer w0.5: Q8.1 25.13,48.84 25.13,50.29 24.5,50.92 D4.2
R: length 53.9
  Bottom Layer w2.5: Q6.3 43.8,23 P5.1
R10_2: length 10.3
  Top Layer w0.5: R11.2 R10.2 13.68,53.98 14.01,54.31 D3.1 17.2,54.31 17.53,53.98 R12.1
R11_1: length 5.9
  Top Layer w0.5: P3.2 4.68,50.43 9.56,50.43
R12_2: length 6.8
  Top Layer w0.5: C6.2 22.02,52.52 21.91,52.63 R12.2 23.01,53.98 23.71,53.29 24.5,53.29 D4.1
R14_2: length 3.5
  Top Layer w0.5: 21.47,19.93 21.24,19.7 18.1,19.7
R15_2: length 3.4
  Top Layer w0.5: R15.2 40.5,20.2 Q2.3
R16_2: length 3.3
  Top Layer w0.5: 56.2,19.44 58.83,19.44 59.31,19.93
R25_2: length 6.1
  Top Layer w0.5: Q9.1 28.81,36.08 28.86,36.12 28.86,37.48
RST: length 35
  Top Layer w0.5: H1.8 32.12,65.16 R4.1 37.33,65.16 37.44,65.05 R5.1 37.44,56.35 37.48,56.32 37.48,43.36 36.35,42.23 36.35,41.03 KEY1.2
  Bottom Layer w0.5: H1.8 H4.8
RXD0: length 9.3
  Bottom Layer w0.5: J2.2 65.64,60.08 H3.7 H2.7
SW1_1: length 10.6
  Top Layer w0.5: SW1.1 49.74,45.89 49.74,46.44 F1.1
SW1_2: length 29.1
  Top Layer w0.5: SW1.2 52.61,41.02 50.65,41.02 46.85,37.22 R1.2 45.95,38.15 45.6,38.51 45.6,40.78 44.6,41.78 42.95,41.78 42.25,41.08 42.25,39.71 41.19,38.65 40.88,38.65 C2.1 40.88,36.16 43.06,33.98 U1.2
TXD0: length 9.3
  Bottom Layer w0.5: J2.1 65.9,64.91 H3.8 H2.8
U1_1: length 9.9
  Top Layer w0.5: R2.1 43.72,39.17 44.44,38.45 R1.1 45.6,36.07 U1.1

## Copper pours and planes (outline as drawn; the poured copper is in the pictures)
+12V on Bottom Layer: -2.68,72.53 71.23,72.53 71.49,72.78 71.49,-3.16 70.72,-3.93 -4.46,-3.93 -5.22,-3.16
GND on Top Layer: -4.46,74.81 71.49,74.81 72.5,73.8 72.5,-2.66 68.95,-6.21 -1.67,-6.21 -2.94,-4.94 -2.94,-4.69 -1.67,-3.42

## Text on the board
Top Silkscreen Layer: Gnd | Tx | Rx | Vcc Out Gnd | WiFi Controller Rev 2.0 | Off | On | Gnd  +12V | R | G | B | +12V | ESP8266 | konovalov inc.
